# EasyEDA Pro project ProPrj_omb-2024-nano_2026-02-09.epro, board PCB1_2
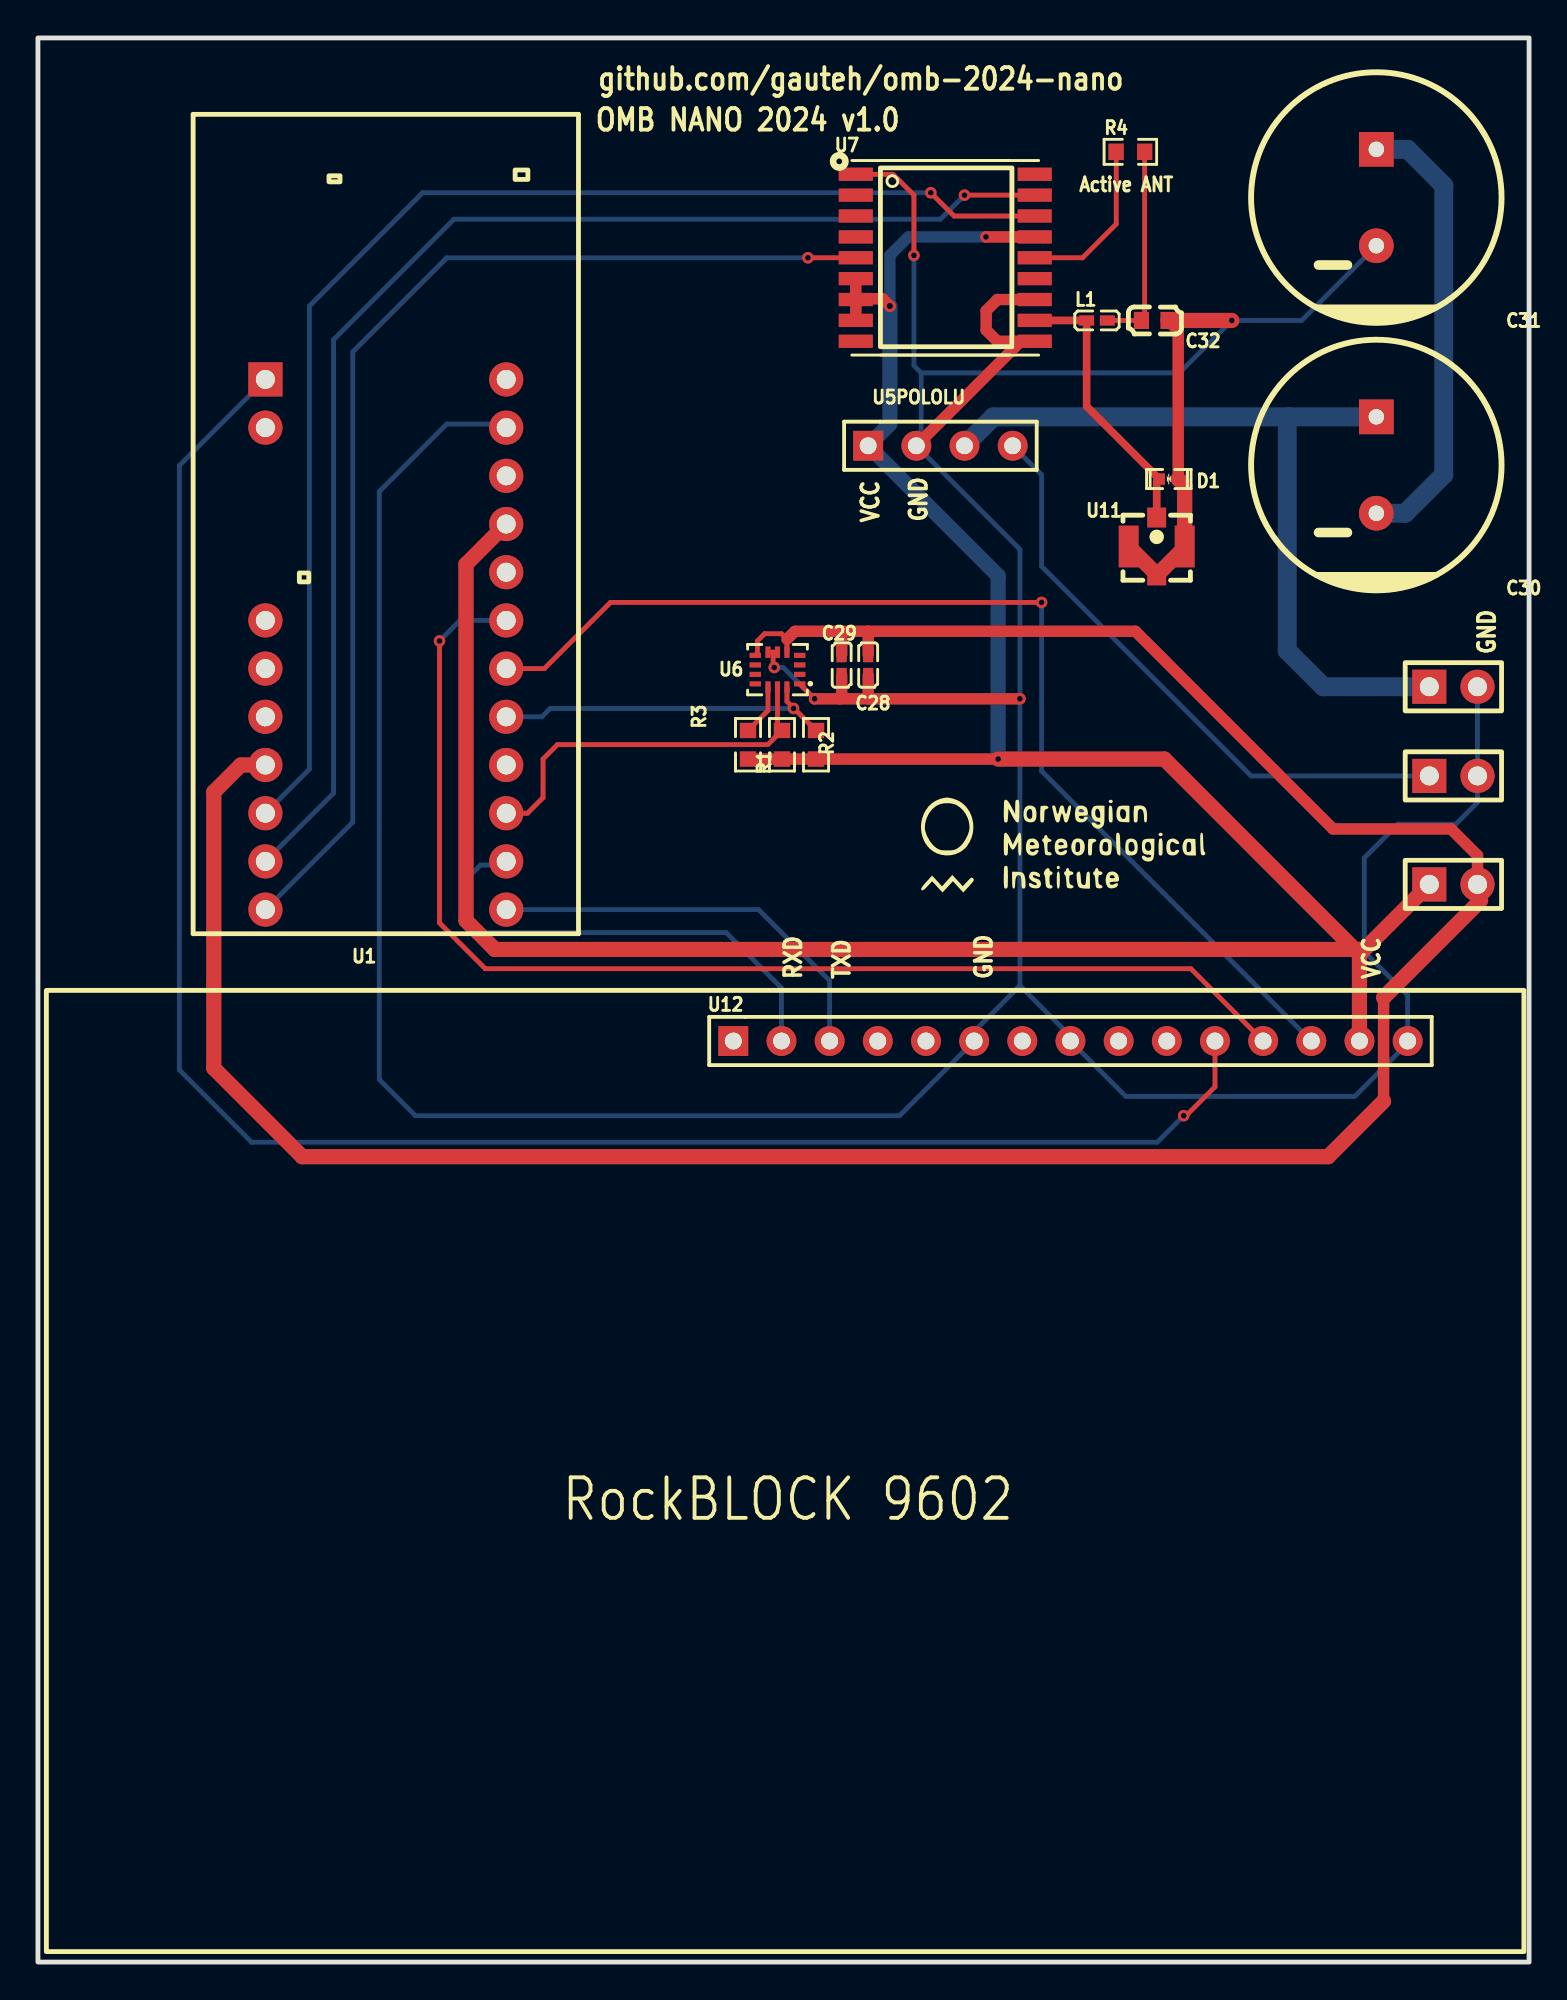
[diagram p15: board, top side]
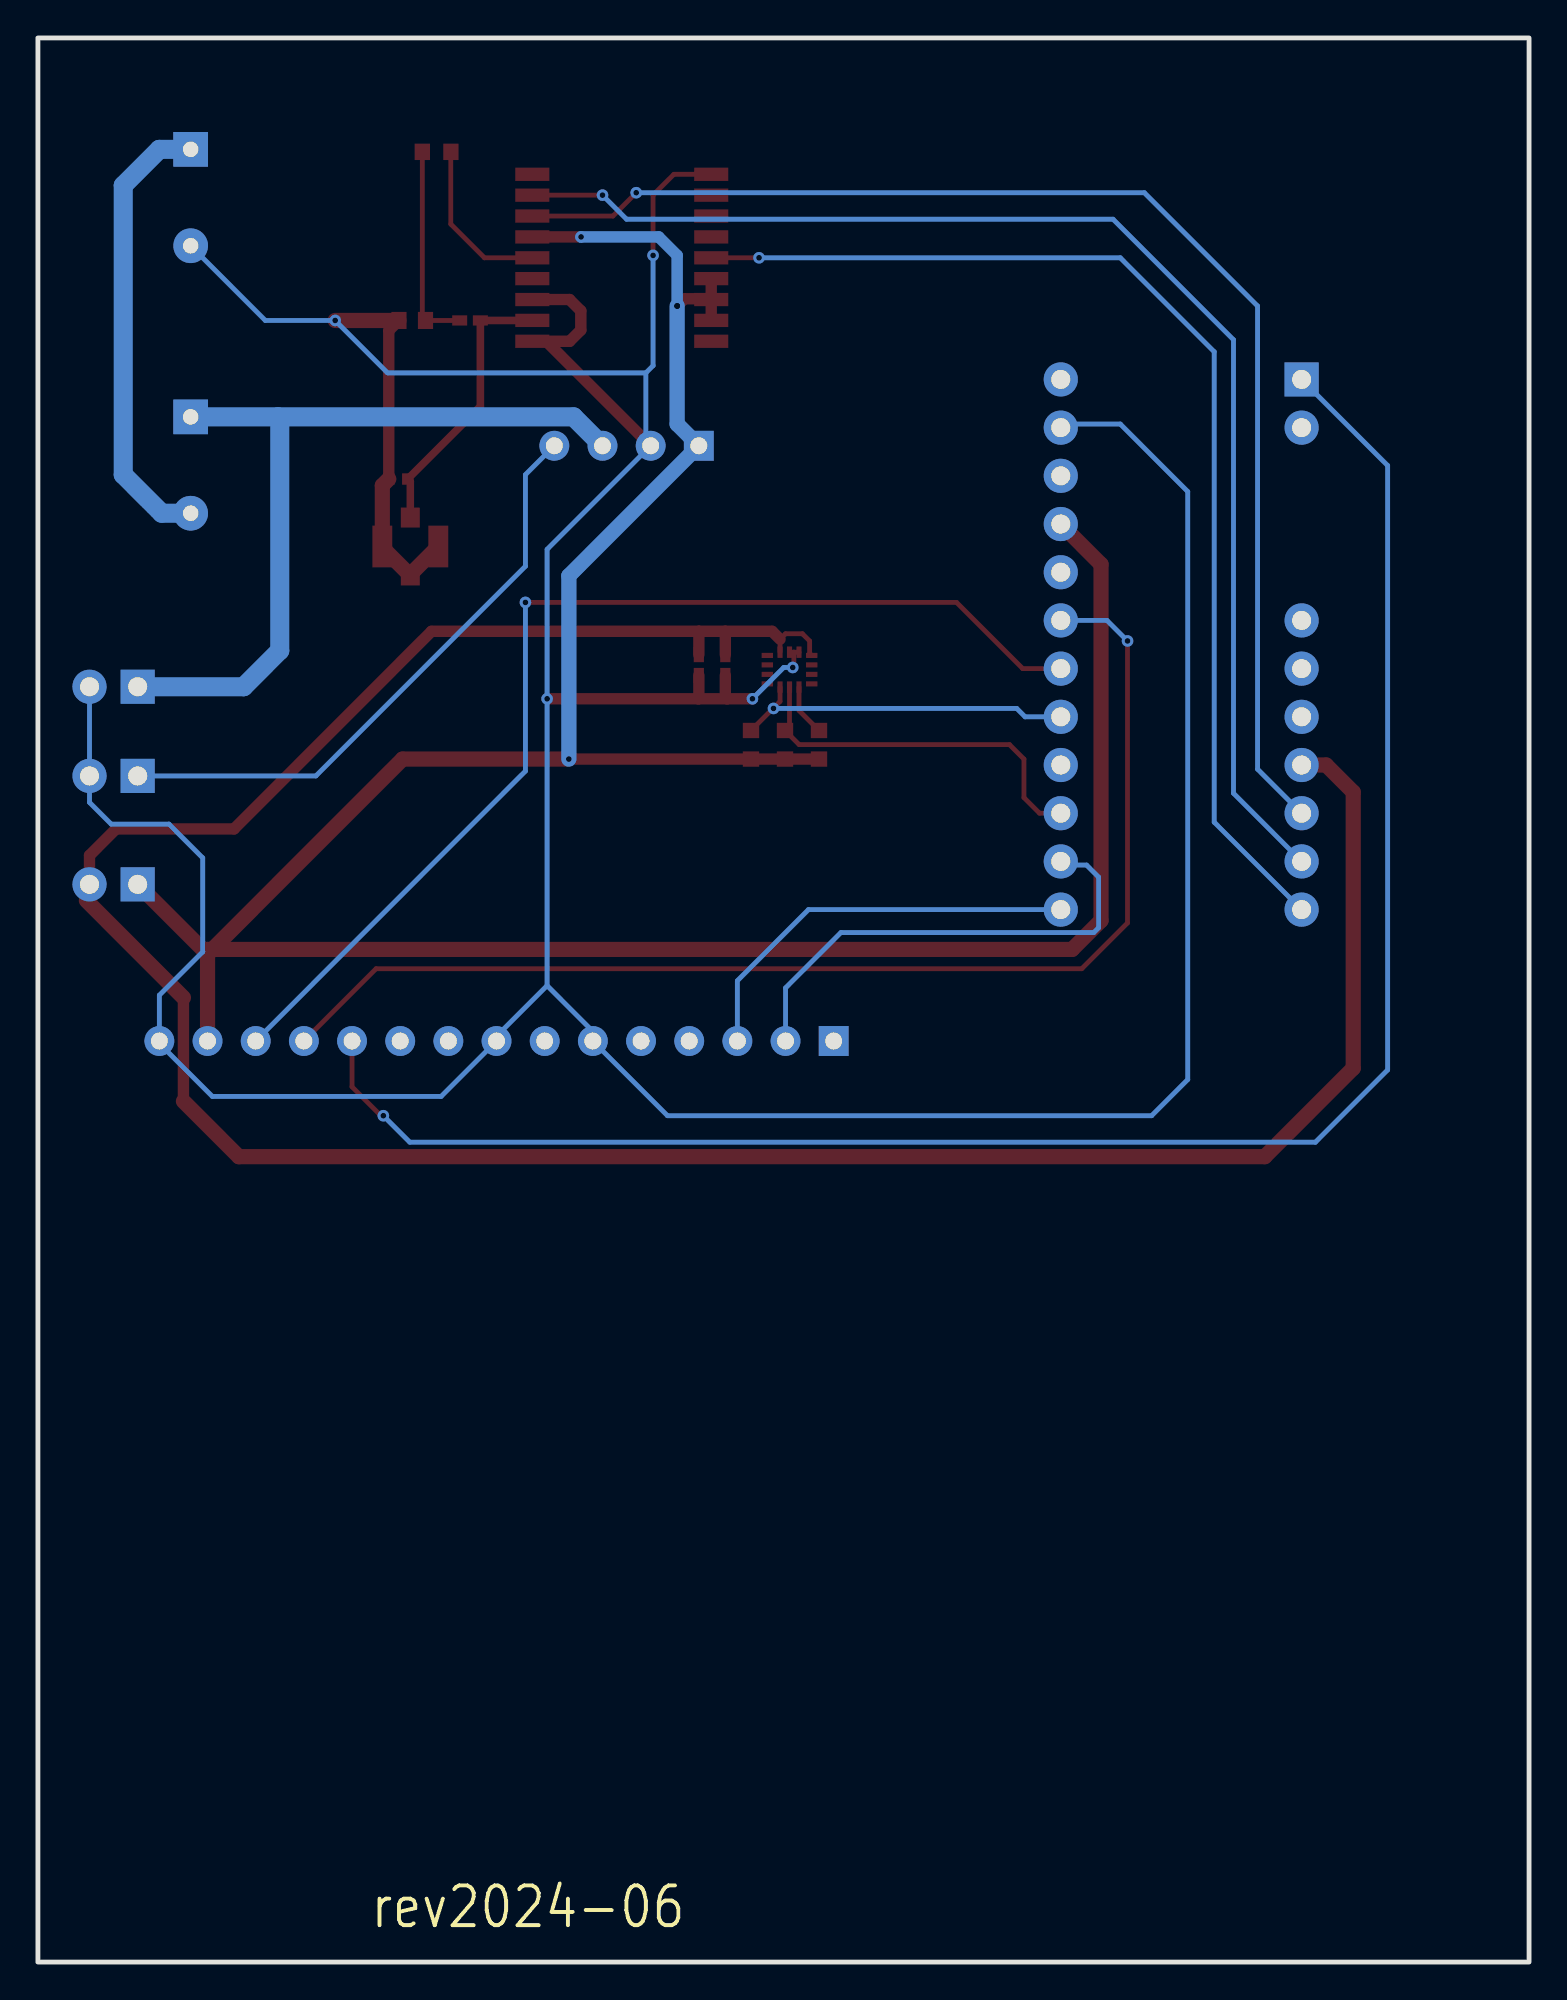
[diagram p16: board, bottom side, seen from below]

Outline 78.63 x 101.4 mm; copper layers: Top Layer, Bottom Layer. Coordinates in mm from the lower left corner of the outline.
Outline path: rectangle 0,101.4 78.63,0
Stack: Top Layer 0.035mm / Dielectric1 1.51mm FR4 er 4.5 / Bottom Layer 0.035mm

## Design rules (mm)
template: JLCPCB Capability(Two Layers Board)
spacing copperThickness1oz (default): track to track 0.102, other pairs 0.152 to 0.3
spacing copperThickness2oz: track to track 0.203, other pairs 0.152 to 0.3
track width copperThickness1oz (default): min 0.127, default 0.254, max 2.54
track width copperThickness2oz: min 0.203, default 0.254, max 2.54
differential pair differentialPair (default): width min 0.127, default 0.254, max 2.54; gap min 0.152, default 0.152
via viaSize (default): diameter min 0.5, default 0.61, max 10; hole min 0.3, default 0.305, max 6.3

## Placement (name value [footprint] x y rotation side)
BAT1  BAT  [HDR-TH_2P-P2.54-V-M-1]  74.64 67.21 0 top
C28  100nF  [C0402]  43.78 68.35 270 top
C29  100nF  [C0402]  42.38 68.35 270 top
C30  10F  [CP_12.5X20MM]  70.58 78.89 180 top
C31  10F  [CP_12.5X20MM]  70.58 92.99 180 top
C32  10nF  [C0603]  58.89 86.51 180 top
D1  PESD0402-240  [D0402-BI]  59.63 78.15 180 top
IMUBACKUPPWR1  IMU_BACKUP_PWR  [HDR-TH_2P-P2.54-V-M-1]  74.64 56.79 0 top
L1  27nH  [L0402]  55.85 86.51 0 top
R1  10K  [R0603]  39.24 64.15 270 top
R2  10K  [R0603]  41.03 64.15 270 top
R3  10K  [R0603]  37.44 64.15 270 top
R4  10  [R0603]  57.61 95.4 0 top
SWEN1  SW_EN  [HDR-TH_2P-P2.54-V-M-1]  74.64 62.51 0 top
U1  -  [ARTEMIS REDBOARD NANO]  24.69 55.46 180 top
U5POLOLU  -  [HDR-F-2.54_1X4]  47.59 79.91 0 top
U6  ISM330DHCXTR  [LGA-14_L3.0-W2.5-P0.50-BR]  39 68.11 0 top
U7  MAX-M10M-00B  [COMM-SMD_L10.1-W9.7-P1.10_GT-1110F2-AGGB]  47.84 89.81 0 top
U11  CONMHF1-SMD-G-T  [RF-SMD_CONMHF1-SMD-G-T]  59 74.6 0 top
U12  -  [HDR-F-2.54_1X15]  54.45 48.54 0 top

## Footprints (pads in the part's own frame, mm; a bottom-side part is the same pattern mirrored in y, then rotated)
ARTEMIS REDBOARD NANO
  rect 1.8x1.8 hole 1: 1(12.7,-27.94)
  round 1.8 hole 1: 2(12.7,-25.4) 3(12.7,-15.24) 4(12.7,-12.7) 5(12.7,-10.16) 6(12.7,-7.62) 7(12.7,-5.08) 8(12.7,-2.54) 9(12.7,0) 10(0,0) 11(0,-2.54) 12(0,-5.08) 13(0,-7.62) 14(0,-10.16) 15(0,-12.7) 16(0,-15.24) 17(0,-17.78) 18(0,-20.32) 19(0,-22.86) 20(0,-25.4) 21(0,-27.94)
C0402
  rect 0.79x0.54 smd: 1(-0.545,0) 2(0.545,0)
C0603
  rect 0.8x0.9 smd: 1(-0.7,0) 2(0.7,0)
COMM-SMD_L10.1-W9.7-P1.10_GT-1110F2-AGGB
  rect 1.8x0.7 smd: 1(-4.718,4.4) 2(-4.718,3.3) 3(-4.718,2.2) 4(-4.718,1.1) 5(-4.718,0) 6(-4.718,-1.1) 7(-4.718,-2.2) 8(-4.718,-3.3) 9(-4.718,-4.4) 10(4.718,-4.4) 11(4.718,-3.3) 12(4.718,-2.2) 13(4.718,-1.1) 14(4.718,0) 15(4.718,1.1) 16(4.718,2.2) 17(4.718,3.3) 18(4.718,4.4)
CP_12.5X20MM
  rect 1.829x1.829 hole 0.813: 1(0,-2.54)
  round 1.829 hole 0.813: 2(0,2.54)
D0402-BI
  rect 0.6x0.6 smd: 1(-0.5,0) 2(0.5,0)
HDR-F-2.54_1X4
  rect 1.575x1.575 hole 0.889: 1(-3.81,0)
  round 1.575 hole 0.889: 2(-1.27,0) 3(1.27,0) 4(3.81,0)
HDR-F-2.54_1X15
  rect 1.575x1.575 hole 0.889: 1(-17.78,0)
  round 1.575 hole 0.889: 2(-15.24,0) 3(-12.7,0) 4(-10.16,0) 5(-7.62,0) 6(-5.08,0) 7(-2.54,0) 8(0,0) 9(2.54,0) 10(5.08,0) 11(7.62,0) 12(10.16,0) 13(12.7,0) 14(15.24,0) 15(17.78,0)
HDR-TH_2P-P2.54-V-M-1
  rect 1.8x1.8 hole 1: 1(-1.27,0)
  round 1.8 hole 1: 2(1.27,0)
L0402
  rect 0.79x0.54 smd: 1(-0.545,0) 2(0.545,0)
LGA-14_L3.0-W2.5-P0.50-BR
  rect 0.6x0.27 smd: 1(1.17,-0.75) 2(1.17,-0.25) 3(1.17,0.25) 4(1.17,0.75) 8(-1.17,0.75) 9(-1.17,0.25) 10(-1.17,-0.25) 11(-1.17,-0.75)
  rect 0.27x0.6 smd: 5(0.5,0.92) 6(0,0.92) 7(-0.5,0.92) 12(-0.5,-0.92) 13(0,-0.92) 14(0.5,-0.92)
R0603
  rect 0.806x0.864 smd: 1(-0.753,0) 2(0.753,0)
RF-SMD_CONMHF1-SMD-G-T
  rect 1x1.05 smd: 1(0,1.525) 4(0,-1.525)
  rect 1.05x2.2 smd: 2(-1.475,0) 3(1.475,0)

## Nets
As in the schematic, except:
GND: BAT1.2 C28.2 C29.2 C31.2 C32.1 D1.1 SWEN1.2 U1.20 U5POLOLU.2 U6.1 U6.6 U6.7 U7.1 U7.10 U7.12 U11.2 U11.3 U11.4 U12.6 U12.8 U12.15
VBAT+: BAT1.1 C30.1 U5POLOLU.3
VCC: IMUBACKUPPWR1.1 R1.2 R2.2 R3.2 U1.18 U5POLOLU.1 U7.6 U7.7 U7.8 U7.15 U12.14
$1N2154: SWEN1.1 U5POLOLU.4

Pads without a net: U1 2 3 4 5 13 17 19 21; U6 2 3 4 9 10 11; U7 2 3 4 9 13 18; U12 1 4 5 7 9 10

## Via types
v1: diameter 0.61, hole 0.305, Top Layer to Bottom Layer, 18 vias

## Routing (per net, layer and track width the routed paths; a pad name or vN(x,y) marks a point on that pad's centre or on a via; arc(x,y) is an arc through that point)
GND: length 252.5
  Top Layer w0.254: 38.77,69.03 38.77,68.28 v1(38.83,68.22) ; 38.77,69.03 U6.7 ; 38.77,69.03 U6.6 ; 51.83,85.41 U7.10 ; v1(40.96,66.57) U6.1 ; U7.1 45.1,94.21 46.19,93.12 v1(46.19,89.94)
  Top Layer w0.6: U5POLOLU.2 51.83,85.41 50.59,85.41 50,86 50,87.02 50.6,87.61 U7.12 ; 43.8,66.57 43.78,66.59 C28.2 ; 43.8,66.57 v1(51.78,66.57) ; 43.8,66.57 42.29,66.57 ; 42.29,66.57 v1(40.96,66.57) ; 42.29,66.57 42.38,66.67 C29.2 ; C32.1 60.13,85.97 D1.1
  Top Layer w0.8: D1.1 60.47,77.81 U11.3 60.47,74.55 U11.4 59,73.12 U11.2 ; v1(62.96,86.51) C32.1
  Bottom Layer w0.254: 51.78,51.46 54.45,48.79 U12.8 57.37,45.62 69.43,45.62 72.23,48.41 U12.15 72.23,50.95 69.94,53.24 69.94,58.19 71.72,59.97 74.77,59.97 75.91,61.11 SWEN1.2 BAT1.2 ; 51.78,51.46 49.37,49.05 U12.6 45.43,44.6 19.9,44.6 18,46.51 18,77.49 21.56,81.05 24.51,81.05 U1.20 ; 51.78,51.46 v1(51.78,66.57) 51.78,74.45 U5POLOLU.2 46.57,80.16 46.57,83.75 ; v1(46.19,89.94) 46.19,84.13 46.57,83.75 ; v1(38.83,68.22) 39.3,68.22 v1(40.96,66.57) ; 46.57,83.75 60.19,83.75 v1(62.96,86.51) 66.64,86.51 C31.2
VBAT+: length 43
  Bottom Layer w1: BAT1.1 67.78,67.21 65.88,69.11 65.88,81.34 65.97,81.43 ; U5POLOLU.3 50.38,81.43 65.97,81.43 ; 65.97,81.43 C30.1
VCC: length 158.1
  Top Layer w0.6: U7.6 U7.7 ; U7.7 U7.8 ; U7.7 43.17,87.65 44.54,87.65 v1(44.92,87.27) ; v1(50.64,63.4) 37.44,63.4 ; v1(49.99,90.91) U7.15
  Top Layer w0.8: 69.69,53.11 69.69,53.36 69.43,53.36 ; 69.69,53.11 U12.14 ; 69.69,53.11 69.43,53.36 ; 69.69,53.11 IMUBACKUPPWR1.1 ; 69.43,53.36 24.1,53.36 22.57,54.89 22.57,73.66 U1.18 ; 69.43,53.36 59.4,63.4 v1(50.64,63.4)
  Bottom Layer w0.6: v1(49.99,90.91) 45.9,90.91 44.92,89.94 v1(44.92,87.27)
  Bottom Layer w0.8: v1(44.92,87.27) 44.92,81.05 U5POLOLU.1 50.64,73.05 v1(50.64,63.4)
GPS_SCL: length 69.1
  Top Layer w0.254: U7.17 52.56,93.12 v1(48.86,93.12)
  Bottom Layer w0.254: U1.8 15.59,61.6 15.59,85.5 21.94,91.85 47.59,91.85 v1(48.86,93.12)
GPS_SDA: length 68.9
  Top Layer w0.254: U7.16 48.31,92.01 v1(47.08,93.24)
  Bottom Layer w0.254: U1.7 14.32,62.87 14.32,87.27 20.29,93.24 v1(47.08,93.24)
GPSWAKE: length 59.9
  Top Layer w0.254: v1(40.61,89.81) U7.5
  Bottom Layer w0.254: v1(40.61,89.81) 21.56,89.81 16.6,84.86 16.6,60.07 U1.9
I_CS: length 2.7
  Top Layer w0.254: R3.1 38.5,65.96 U6.12
I_SCL: length 19.9
  Top Layer w0.254: U6.13 39,65.14 R1.1 38.49,64.16 27.4,64.16 26.64,63.4 26.64,61.37 25.81,60.54 U1.12
I_SDA: length 18.3
  Top Layer w0.254: U6.14 39.5,66.44 39.87,66.06 ; 39.87,66.06 R2.1 ; 39.87,66.06 v1(39.84,66.06)
  Bottom Layer w0.254: v1(39.84,66.06) 27.02,66.06 26.57,65.62 U1.14
I_VCC: length 144.2
  Top Layer w0.254: U6.5 39.5,69.71 39.21,70 38.32,70 37.94,69.62 37.94,68.97 U6.8
  Top Layer w0.6: 39.5,69.71 39.92,70.13 42.39,70.13 ; 70.96,50.82 70.96,45.36 ; IMUBACKUPPWR1.2 75.91,58.32 74.51,59.71 68.29,59.71 57.88,70.13 43.78,70.13 ; 43.78,70.13 42.39,70.13 ; 43.78,70.13 43.78,70.13 C28.1 ; 42.39,70.13 42.38,70.13 C29.1
  Top Layer w0.8: 70.96,50.82 76.08,55.94 ; U1.6 10.7,63.08 9.27,61.66 9.27,47.1 13.94,42.44 68.04,42.44 70.96,45.36
$1N1205: length 58.7
  Top Layer w0.254: U1.15 26.7,68.16 30.19,71.65 v1(52.92,71.65)
  Bottom Layer w0.254: v1(52.92,71.65) 52.92,62.76 v1(67.15,48.54)
$1N1212: length 25.6
  Bottom Layer w0.254: U12.2 39.21,51.33 36.29,54.25 22.95,54.25 22.7,54.51 22.7,57.17 23.33,57.81 24.5,57.81 U1.11
$1N1219: length 21.8
  Bottom Layer w0.254: U1.10 38,55.46 41.75,51.71 U12.3
$1N1582: length 64.8
  Top Layer w0.254: v1(21.17,69.62) 21.17,54.76 23.59,52.35 60.8,52.35 U12.12
  Bottom Layer w0.254: v1(21.17,69.62) 22.26,70.7 U1.16
$1N1610: length 98
  Top Layer w0.254: U12.11 62.07,46.13 60.54,44.6
  Bottom Layer w0.254: v1(60.42,44.6) 59.02,43.2 11.27,43.2 7.46,47.01 7.46,78.87 U1.1
$1N2154: length 31.4
  Bottom Layer w0.254: 72.74,62.51 63.97,62.51 52.92,73.56 52.92,78.38 U5POLOLU.4
$1N2984: length 24
  Bottom Layer w1: C31.1 72.23,95.53 74.13,93.62 74.13,78.38 72.1,76.35 C30.2
$1N5235: length 8.8
  Top Layer w0.254: R4.1 56.86,95.39 56.86,91.59 55.08,89.81 U7.14
$1N5486: length 14.8
  Top Layer w0.4: U7.11 52.56,86.51 L1.1 55.3,81.98 D1.2 59,78.02 U11.1
$1N5497: length 10.8
  Top Layer w0.254: L1.2 C32.2 58.36,86.68 R4.2

## Copper pours and planes (outline as drawn; the poured copper is in the pictures)
GND on Bottom Layer: -4.73,104.16 79.34,104.16 79.34,-5.31 -4.73,-5.31

## Text on the board
Bottom Silkscreen Layer: rev2024-06
Top Silkscreen Layer: Active ANT | RXD | TXD | VCC | GND | OMB NANO 2024 v1.0 | github.com/gauteh/omb-2024-nano | RockBLOCK 9602
